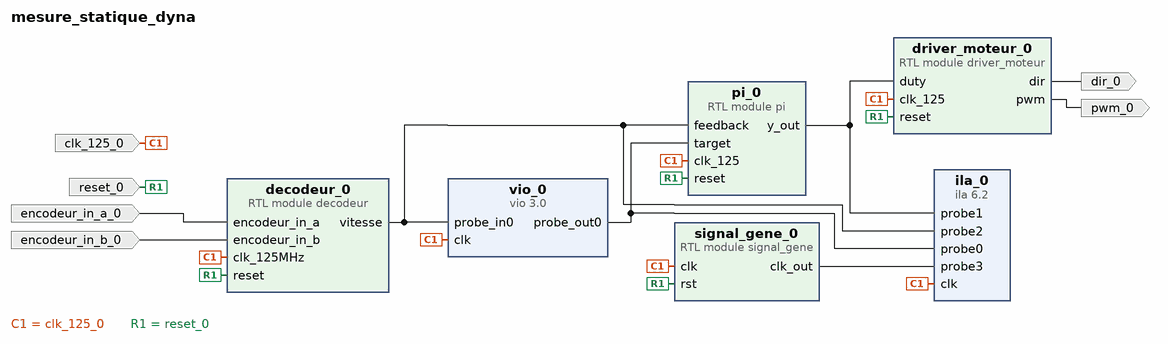
[diagram p0: block diagram of the top level]
# Vivado block design mesure_statique_dyna, xc7z010clg400-1, Vivado 2020.2
create_bd_design mesure_statique_dyna

create_bd_port -dir I clk_125_0
create_bd_port -dir I -type rst reset_0
create_bd_port -dir I encodeur_in_a_0
create_bd_port -dir I encodeur_in_b_0
create_bd_port -dir O pwm_0
create_bd_port -dir O dir_0

create_bd_cell -type ip -vlnv xilinx.com:ip:vio:3.0 vio_0
set_property -dict {CONFIG.C_NUM_PROBE_OUT 1 CONFIG.C_PROBE_IN0_WIDTH 16 CONFIG.C_PROBE_OUT0_WIDTH 16} [get_bd_cells vio_0]
create_bd_cell -type ip -vlnv xilinx.com:ip:ila:6.2 ila_0
set_property -dict [list \
  CONFIG.ALL_PROBE_SAME_MU_CNT 3 \
  CONFIG.C_ADV_TRIGGER true \
  CONFIG.C_DATA_DEPTH 8192 \
  CONFIG.C_ENABLE_ILA_AXI_MON false \
  CONFIG.C_EN_STRG_QUAL 1 \
  CONFIG.C_MONITOR_TYPE Native \
  CONFIG.C_NUM_OF_PROBES 4 \
  CONFIG.C_PROBE0_MU_CNT 3 \
  CONFIG.C_PROBE0_WIDTH 16 \
  CONFIG.C_PROBE1_MU_CNT 3 \
  CONFIG.C_PROBE1_WIDTH 16 \
  CONFIG.C_PROBE2_MU_CNT 3 \
  CONFIG.C_PROBE3_MU_CNT 3 \
  CONFIG.C_TRIGIN_EN false \
] [get_bd_cells ila_0]
create_bd_cell -type module -reference decodeur decodeur_0
create_bd_cell -type module -reference signal_gene signal_gene_0
create_bd_cell -type module -reference driver_moteur driver_moteur_0
create_bd_cell -type module -reference pi pi_0

# ---- connections ----

connect_bd_net -net clk_125_0_1 [get_bd_ports clk_125_0] \
  [get_bd_pins vio_0/clk] [get_bd_pins ila_0/clk] [get_bd_pins decodeur_0/clk_125MHz] [get_bd_pins signal_gene_0/clk] \
  [get_bd_pins driver_moteur_0/clk_125] [get_bd_pins pi_0/clk_125]
connect_bd_net -net reset_0_1 [get_bd_ports reset_0] \
  [get_bd_pins decodeur_0/reset] [get_bd_pins signal_gene_0/rst] [get_bd_pins driver_moteur_0/reset] [get_bd_pins pi_0/reset]
connect_bd_net -net encodeur_in_a_0_1 [get_bd_ports encodeur_in_a_0] [get_bd_pins decodeur_0/encodeur_in_a]
connect_bd_net -net encodeur_in_b_0_1 [get_bd_ports encodeur_in_b_0] [get_bd_pins decodeur_0/encodeur_in_b]
connect_bd_net [get_bd_pins driver_moteur_0/pwm] [get_bd_ports pwm_0]
connect_bd_net [get_bd_pins driver_moteur_0/dir] [get_bd_ports dir_0]
connect_bd_net -net vio_0_probe_out0 [get_bd_pins pi_0/y_out] [get_bd_pins ila_0/probe1] [get_bd_pins driver_moteur_0/duty]
connect_bd_net [get_bd_pins decodeur_0/vitesse] [get_bd_pins vio_0/probe_in0] [get_bd_pins ila_0/probe2] [get_bd_pins pi_0/feedback]
connect_bd_net [get_bd_pins vio_0/probe_out0] [get_bd_pins ila_0/probe0] [get_bd_pins pi_0/target]
connect_bd_net [get_bd_pins signal_gene_0/clk_out] [get_bd_pins ila_0/probe3]

validate_bd_design
save_bd_design
